# Altium schematic sheet Sheet_hardware.SchDoc
size A4
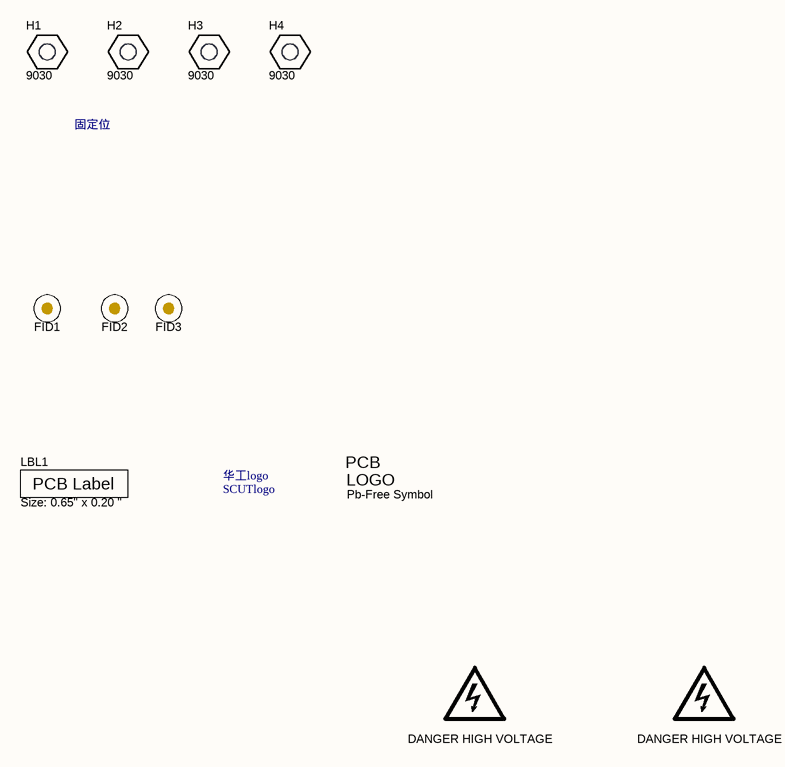
[diagram p0: Sheet_hardware.SchDoc]

## Parts
CAUTION_1  DANGER HIGH VOLTAGE  [IEC_HighVoltage_Small]  (no BOM)
CAUTION_2  DANGER HIGH VOLTAGE  [jingdian]  (no BOM)
FID1  Fiducial  [Fiducial10-20]  (value not drawn)
FID2  Fiducial  [Fiducial10-20]  (value not drawn)
FID3  Fiducial  [Fiducial10-20]  (value not drawn)
H1  9030  [Keystone_9030]
H2  9030  [Keystone_9030]
H3  9030  [Keystone_9030]
H4  9030  [Keystone_9030]
LBL1  Size: 0.65" x 0.20 "  [Label_650x200]
Logo2  Pb-Free Symbol  [Pb-Free_Overlay_Small]  (no BOM)
LOGO3  SCUTlogo  [SCUTlogo]

## Notes on the sheet
- 固定位
- (in symbol Pb-Free) PCB; LOGO
- (in symbol SCUTlogo) 华工logo
- (in symbol THT-14-423-10) PCB Label

## Library data of the parts
CAUTION_1 CAUTION_2 = IEC_HighVoltage: IEC 61010-1 High Voltage Warning; SymbolCreator: a0412235; SymbolVersion: 2011-08-22; Published: 2009-03-03; Publisher: Texas Instruments; LatestRevisionDate: 2014-11-20
FID1-FID3 = Fiducial: Fiducial mark.  There is nothing to buy or mount.; SymbolCreator: codlsc; SymbolVersion: 2009-11-4; CompType: Fiducial; Publisher: Texas Instruments; LatestRevisionDate: 2014-08-01; LatestRevisionNote: Added Alternate PartNumber and Alternate Manufacturer parameters to appropriate components.; Manufacturer: N/A; MountType: N/A; PackageReference: Fiducial; PartNumber: N/A; ClassName: FiducialMark
H1-H4 = 9030: BRD SPT SNAP LOCK SCREW MNT 3/8"; Manufacturer: Keystone; SymbolCreator: a0412235; CompType: Nylon Spacer; SymbolVersion: 2013-06-24; PartNumber: 9030; RoHS: Y; PackageReference: BRD SPT SNAP LOCK SCREW MNT 3/8"; MountType: TH; ComponentLink1Description: Datasheet Link; ComponentLink1URL: http://www.keyelco.com/userAssets/file/M60-2p77.pdf; Publisher: Texas Instruments; LatestRevisionDate: 2015-08-11; Supplier 1: Digi-Key; Supplier Part Number 1: 36-9030-ND; Supplier 2: Mouser; Supplier Part Number 2: 534-9030
LBL1 = THT-14-423-10: Thermal Transfer Printable Labels, 0.650" W x 0.200" H - 10,000 per roll; Manufacturer: Brady; SymbolCreator: a0412235; CompType: Label; SymbolVersion: 2012-06-12; ClassName: Label; PartNumber: THT-14-423-10; RoHS: Y; PackageReference: PCB Label 0.650"H x 0.200"W; MountType: N/A; ComponentLink1Description: Web Page; ComponentLink1URL: http://www.bradyid.com/bradyid/pdpv/THT-14-423-10.html; Note: Size: 0.65" x 0.20 "; Publisher: Texas Instruments; LatestRevisionDate: 2012-07-31; LatestRevisionNote: Initial Version; Alternate Manufacturer: -; Alternate PartNumber: -; Supplier 1: Farnell; Supplier Part Number 1: 2065596; Supplier 2: Newark; Supplier Part Number 2: 97C5133
Logo2 = Pb-Free: SymbolCreator: a0412235; SymbolVersion: 2011-08-22; Published: 2009-03-03; Publisher: Texas Instruments; LatestRevisionDate: 2014-08-05